# Altium schematic sheet FET_PowerPath.SchDoc
size 299 x 299 mm; SheetNumber: 2; SheetTotal: 4
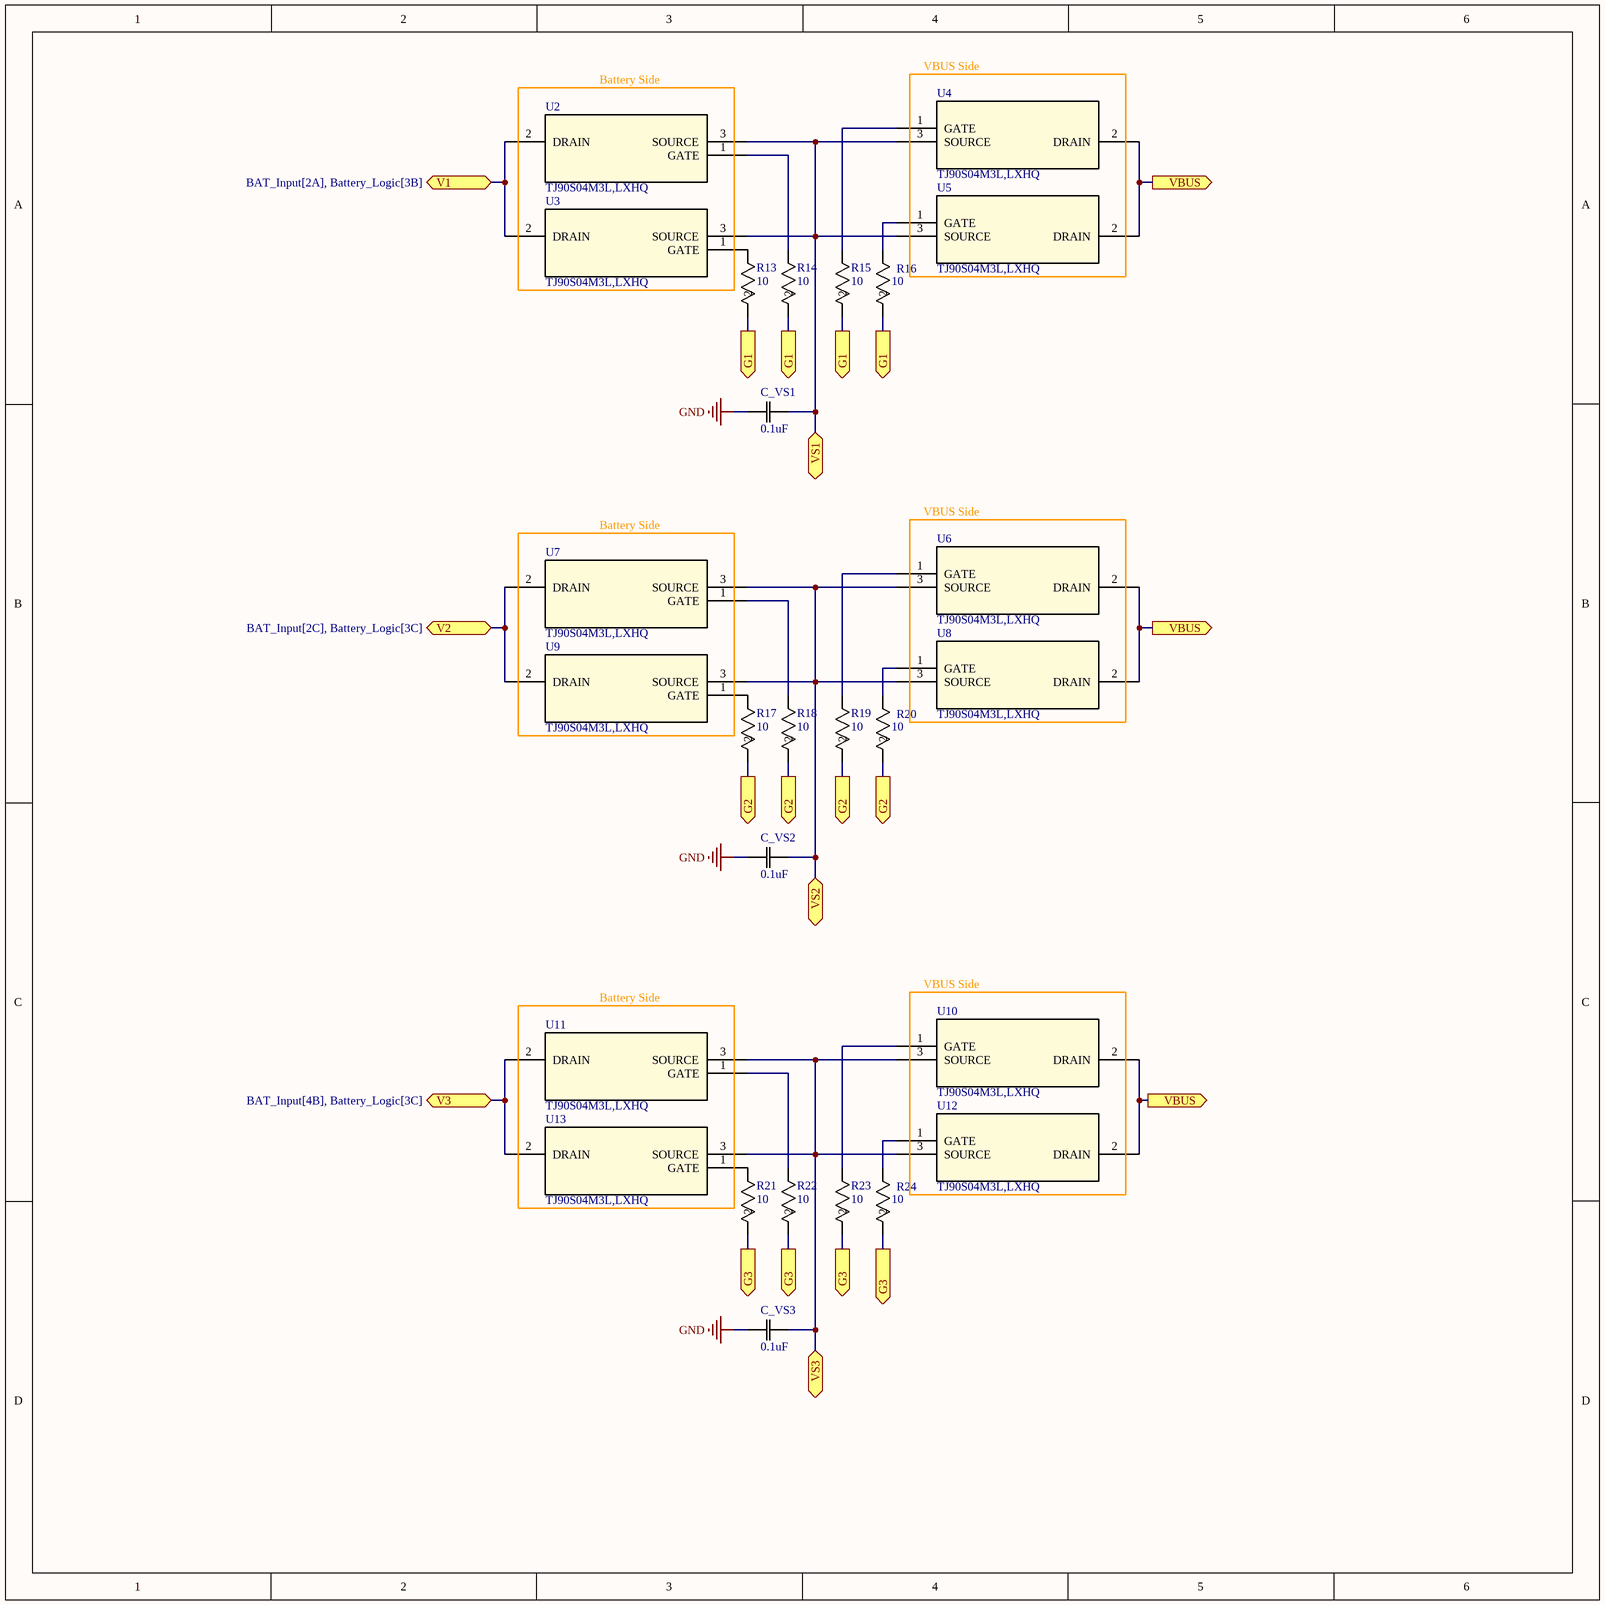
[diagram p0: FET_PowerPath.SchDoc]

## Parts
C_VS1  0.1uF  [CAP_GCM1555_0402_MUR]
C_VS2  0.1uF  [CAP_GCM1555_0402_MUR]
C_VS3  0.1uF  [CAP_GCM1555_0402_MUR]
R13  10  [RES_CRCW_0805]
R14  10  [RES_CRCW_0805]
R15  10  [RES_CRCW_0805]
R16  10  [RES_CRCW_0805]
R17  10  [RES_CRCW_0805]
R18  10  [RES_CRCW_0805]
R19  10  [RES_CRCW_0805]
R20  10  [RES_CRCW_0805]
R21  10  [RES_CRCW_0805]
R22  10  [RES_CRCW_0805]
R23  10  [RES_CRCW_0805]
R24  10  [RES_CRCW_0805]
U2  TJ90S04M3L,LXHQ  [DPAK+_TOS]
U3  TJ90S04M3L,LXHQ  [DPAK+_TOS]
U4  TJ90S04M3L,LXHQ  [DPAK+_TOS]
U5  TJ90S04M3L,LXHQ  [DPAK+_TOS]
U6  TJ90S04M3L,LXHQ  [DPAK+_TOS]
U7  TJ90S04M3L,LXHQ  [DPAK+_TOS]
U8  TJ90S04M3L,LXHQ  [DPAK+_TOS]
U9  TJ90S04M3L,LXHQ  [DPAK+_TOS]
U10  TJ90S04M3L,LXHQ  [DPAK+_TOS]
U11  TJ90S04M3L,LXHQ  [DPAK+_TOS]
U12  TJ90S04M3L,LXHQ  [DPAK+_TOS]
U13  TJ90S04M3L,LXHQ  [DPAK+_TOS]

## Blocks framed on the sheet
Battery Side: U2 U3
VBUS Side: U4 U5
Battery Side: U7 U9
VBUS Side: U6 U8
Battery Side: U11 U13
VBUS Side: U10 U12

## Ports
G1 (out, see Battery_Logic[3C], FET_PowerPath[3A], FET_PowerPath[4A]), G2 (out, see Battery_Logic[3C], FET_PowerPath[3C], FET_PowerPath[4C]), G3 (out, see Battery_Logic[3C], FET_PowerPath[3D], FET_PowerPath[4D]), V1 (bidir, see BAT_Input[2A], Battery_Logic[3B]), V2 (bidir, see BAT_Input[2C], Battery_Logic[3C]), V3 (bidir, see BAT_Input[4B], Battery_Logic[3C]), VBUS (out, see Battery_Logic[4C], Buck_Converter[1C], FET_PowerPath[5A], FET_PowerPath[5B]), VBUS (out, see Battery_Logic[4C], Buck_Converter[1C], FET_PowerPath[5A], FET_PowerPath[5C]), VBUS (out, see Battery_Logic[4C], Buck_Converter[1C], FET_PowerPath[5B], FET_PowerPath[5C]), VS1 (bidir, see Battery_Logic[3C]), VS2 (bidir, see Battery_Logic[3C]), VS3 (bidir, see Battery_Logic[3C])

## Nets
GND: C_VS1.2 C_VS2.2 C_VS3.2
G1: R13.2 R14.2 R15.2 R16.2 ; port G1
G2: R17.2 R18.2 R19.2 R20.2 ; port G2
G3: R21.2 R22.2 R23.2 R24.2 ; port G3
V1: U2.2(DRAIN) U3.2(DRAIN) ; port V1
V2: U7.2(DRAIN) U9.2(DRAIN) ; port V2
V3: U11.2(DRAIN) U13.2(DRAIN) ; port V3
VBUS: U4.2(DRAIN) U5.2(DRAIN) U6.2(DRAIN) U8.2(DRAIN) U10.2(DRAIN) U12.2(DRAIN) ; port VBUS
VS1: C_VS1.1 U2.3(SOURCE) U3.3(SOURCE) U4.3(SOURCE) U5.3(SOURCE) ; port VS1
VS2: C_VS2.1 U6.3(SOURCE) U7.3(SOURCE) U8.3(SOURCE) U9.3(SOURCE) ; port VS2
VS3: C_VS3.1 U10.3(SOURCE) U11.3(SOURCE) U12.3(SOURCE) U13.3(SOURCE) ; port VS3
NetR13_1: R13.1 U3.1(GATE)
NetR14_1: R14.1 U2.1(GATE)
NetR15_1: R15.1 U4.1(GATE)
NetR16_1: R16.1 U5.1(GATE)
NetR17_1: R17.1 U9.1(GATE)
NetR18_1: R18.1 U7.1(GATE)
NetR19_1: R19.1 U6.1(GATE)
NetR20_1: R20.1 U8.1(GATE)
NetR21_1: R21.1 U13.1(GATE)
NetR22_1: R22.1 U11.1(GATE)
NetR23_1: R23.1 U10.1(GATE)
NetR24_1: R24.1 U12.1(GATE)

## Library data of the parts
C_VS1-C_VS3 = GCM155R71H104KE02J: Description; Manufacturer_Name: Murata; Copyright: Copyright (C) 2026 Ultra Librarian. All rights reserved.; Manufacturer_Part_Number: GCM155R71H104KE02J
R13-R24 = CRCW080510R0FKEA: D12/CRCW0805 100 10R 1% ET1 e3; Manufacturer_Name: Vishay; Copyright: Copyright (C) 2026 Ultra Librarian. All rights reserved.; Manufacturer_Part_Number: CRCW080510R0FKEA
U2-U13 = TJ90S04M3L,LXHQ: P-ch MOSFET, -40 V, -90 A, 0.0043 Î©@10V, DPAK+; Manufacturer_Name: Toshiba Electronic Devices & Storage Corp.; Copyright: Copyright (C) 2026 Ultra Librarian. All rights reserved.; Manufacturer_Part_Number: TJ90S04M3L,LXHQ; Datasheet: https://toshiba.semicon-storage.com/info/docget.jsp?did=58174&prodName=TJ90S04M3L; RefDes: RefDes; Type: Type